# Altium schematic sheet 11_Audio_CODEC.SchDoc
size A3; SheetNumber: 2; SheetTotal: 21
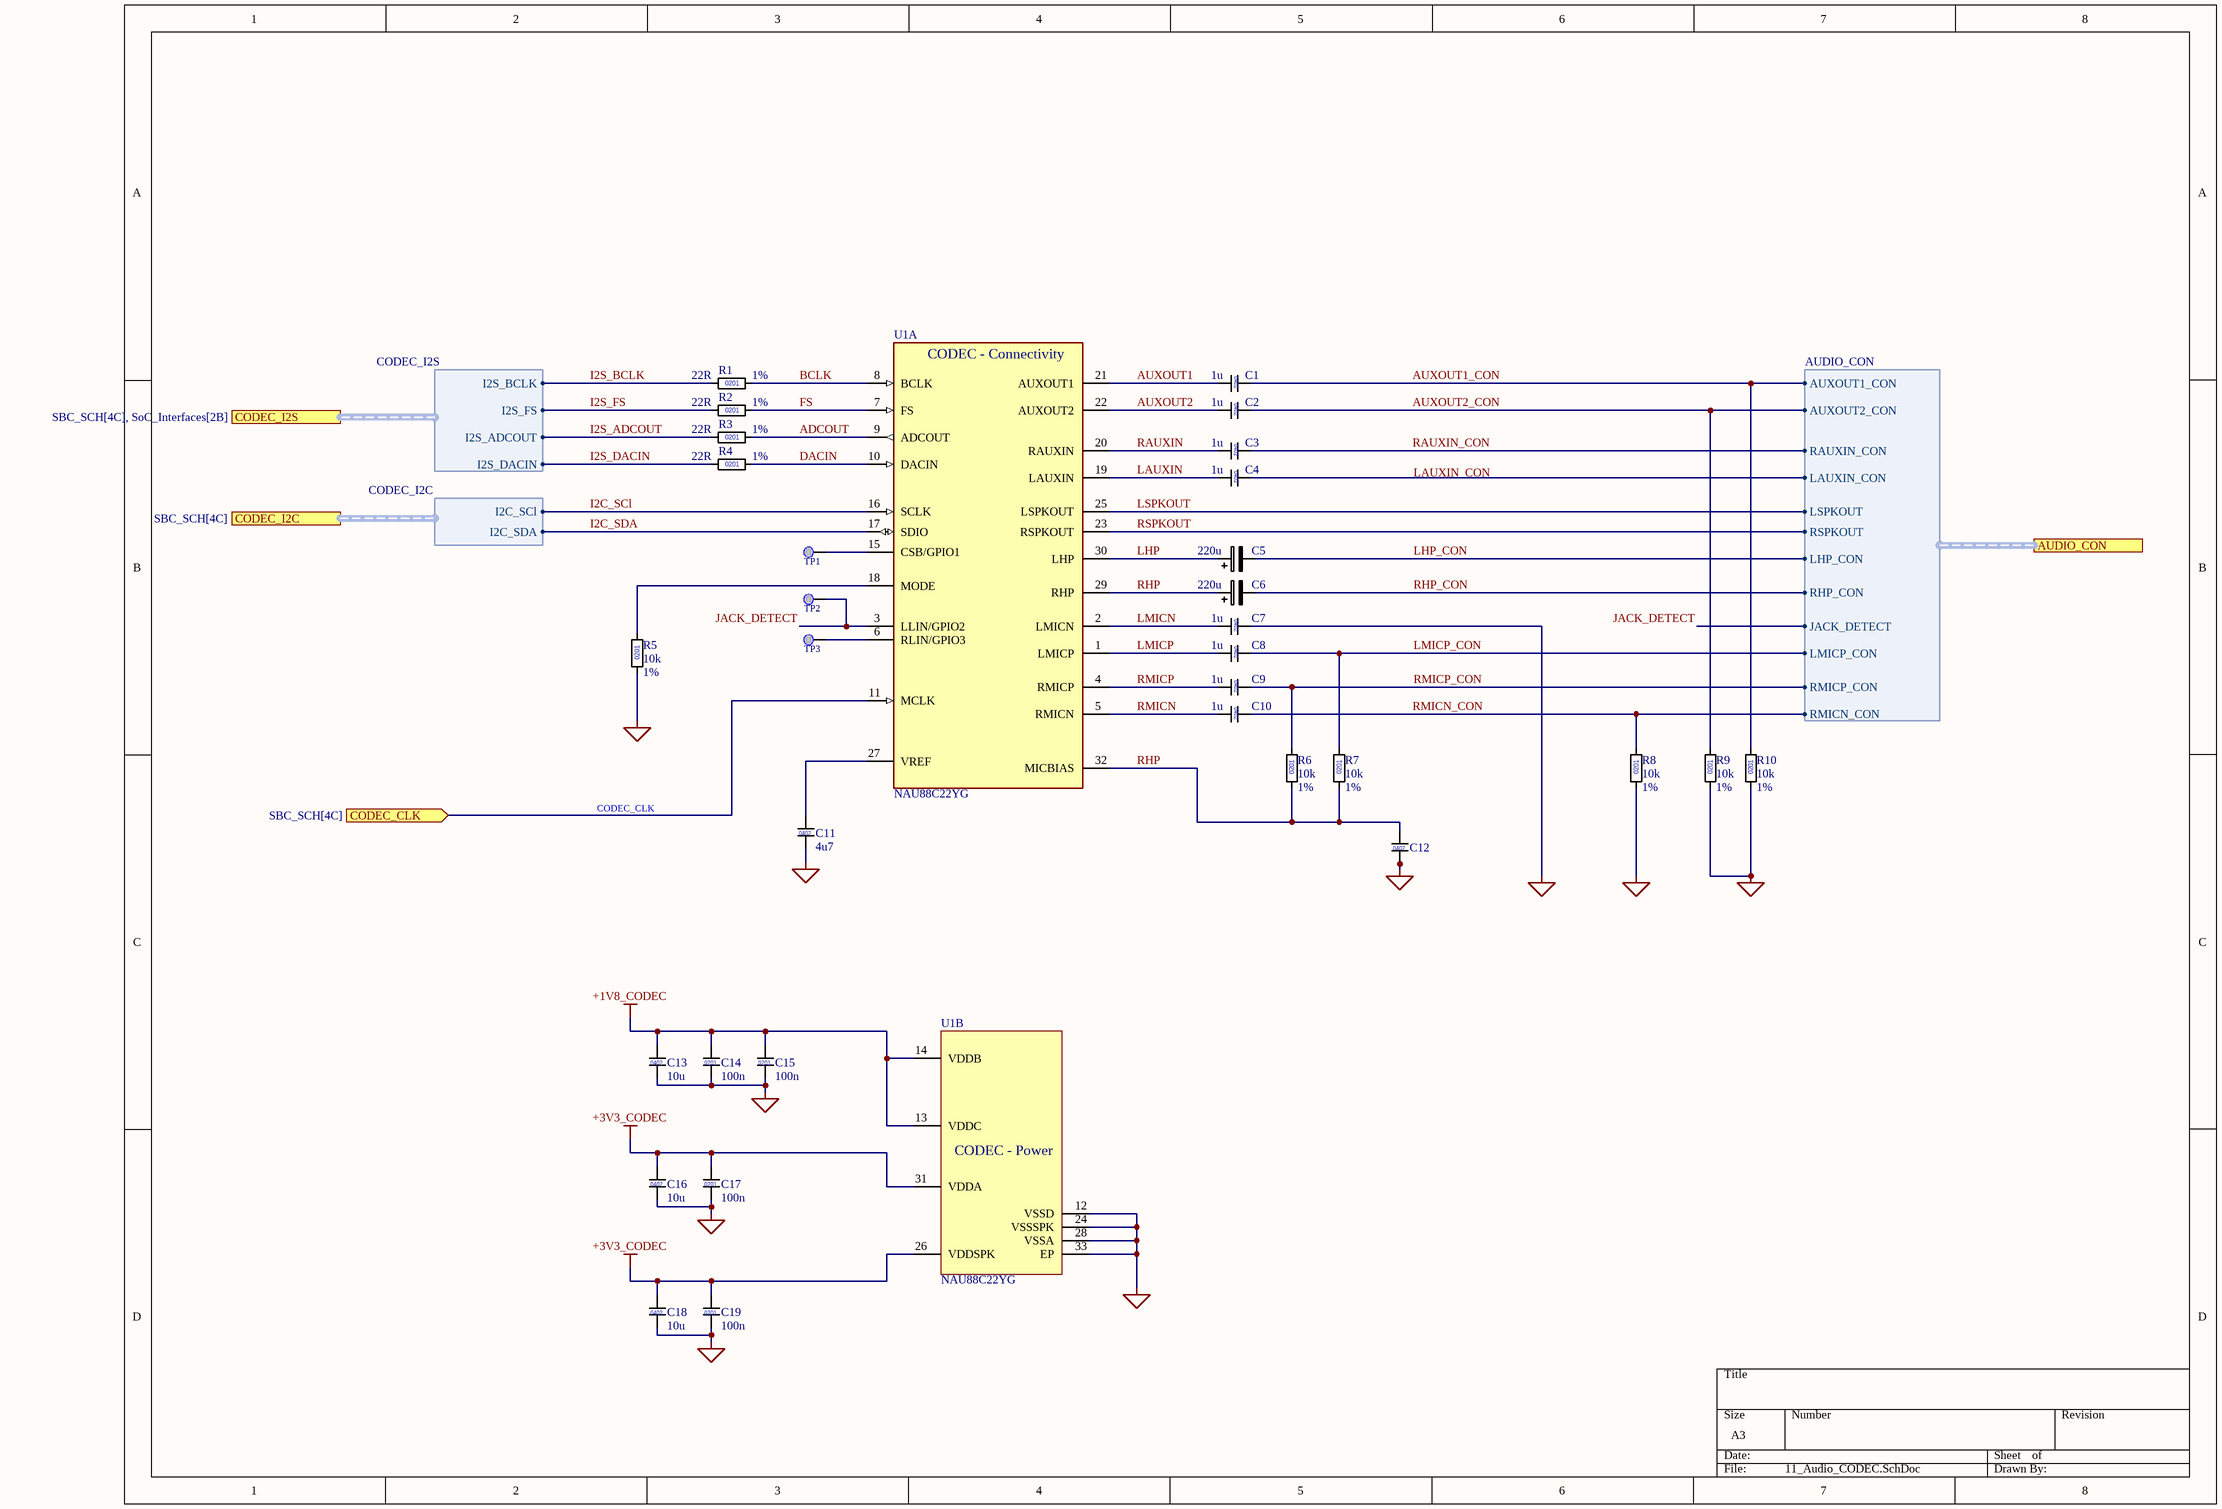
[diagram p0: 11_Audio_CODEC.SchDoc]

## Parts
C1  1u  [C0402]
C2  1u  [C0402]
C3  1u  [C0402]
C4  1u  [C0402]
C5  220u
C6  220u
C7  1u  [C0402]
C8  1u  [C0402]
C9  1u  [C0402]
C10  1u  [C0402]
C11  4u7  [C0402]
C12  1u  [C0402]  (value not drawn)
C13  value 10u  [C0402]  (hidden comment: 4u7)
C14  value 100n  [C0201]  (hidden comment: C_0201)
C15  value 100n  [C0201]  (hidden comment: C_0201)
C16  value 10u  [C0402]  (hidden comment: 4u7)
C17  value 100n  [C0201]  (hidden comment: C_0201)
C18  value 10u  [C0402]  (hidden comment: 4u7)
C19  value 100n  [C0201]  (hidden comment: C_0201)
R1  value 22R  Tolerance: 1%  [R0201]  (hidden comment: 0201)
R2  value 22R  Tolerance: 1%  [R0201]  (hidden comment: 0201)
R3  value 22R  Tolerance: 1%  [R0201]  (hidden comment: 0201)
R4  value 22R  Tolerance: 1%  [R0201]  (hidden comment: 0201)
R5  value 10k  Tolerance: 1%  [R0201]  (hidden comment: 0201)
R6  value 10k  Tolerance: 1%  [R0201]  (hidden comment: 0201)
R7  value 10k  Tolerance: 1%  [R0201]  (hidden comment: 0201)
R8  value 10k  Tolerance: 1%  [R0201]  (hidden comment: 0201)
R9  value 10k  Tolerance: 1%  [R0201]  (hidden comment: 0201)
R10  value 10k  Tolerance: 1%  [R0201]  (hidden comment: 0201)
TP1  Testpoint 0.5mm  [TP_0.50mm]  (value not drawn)  (no BOM)
TP2  Testpoint 0.5mm  [TP_0.50mm]  (value not drawn)  (no BOM)
TP3  Testpoint 0.5mm  [TP_0.50mm]  (value not drawn)  (no BOM)
U1  NAU88C22YG  [VQFN-32-1EP_5x5mm_P0.5mm_EP3.5x3.5mm]  (parts A,B of 2)

## Ports
AUDIO_CON (harness AUDIO_CON, see SBC_SCH[4C], Audio_Connector[1B]), CODEC_CLK (in, see SBC_SCH[4C]), CODEC_I2C (harness CODEC_I2C, see SBC_SCH[4C]), CODEC_I2S (harness CODEC_I2S, see SBC_SCH[4C], SoC_Interfaces[2B])

## Harnesses
CODEC_I2S: I2S_BCLK, I2S_FS, I2S_ADCOUT, I2S_DACIN
CODEC_I2C: I2C_SCl, I2C_SDA
AUDIO_CON: AUXOUT1_CON, AUXOUT2_CON, RAUXIN_CON, LAUXIN_CON, LHP_CON, RHP_CON, LMICP_CON, RMICP_CON, RMICN_CON, LSPKOUT, RSPKOUT, JACK_DETECT

## Nets
+1V8_CODEC: C13.1 C14.1 C15.1 U1.13(VDDC) U1.14(VDDB)
+3V3_CODEC: C16.1 C17.1 C18.1 C19.1 U1.26(VDDSPK) U1.31(VDDA)
GND: C7.2 C11.2 C12.2 C13.2 C14.2 C15.2 C16.2 C17.2 C18.2 C19.2 R5.1 R8.1 R9.1 R10.1 U1.12(VSSD) U1.24(VSSSPK) U1.28(VSSA) U1.33(EP)
ADCOUT: R3.2 U1.9(ADCOUT)
AUXOUT1: C1.1 U1.21(AUXOUT1)
AUXOUT1_CON: C1.2 R10.2 ; port AUDIO_CON.AUXOUT1_CON
AUXOUT2: C2.1 U1.22(AUXOUT2)
AUXOUT2_CON: C2.2 R9.2 ; port AUDIO_CON.AUXOUT2_CON
BCLK: R1.2 U1.8(BCLK)
CODEC_CLK: U1.11(MCLK) ; port CODEC_CLK
DACIN: R4.2 U1.10(DACIN)
FS: R2.2 U1.7(FS)
I2C_SCl: U1.16(SCLK) ; port CODEC_I2C.I2C_SCl
I2C_SDA: U1.17(SDIO) ; port CODEC_I2C.I2C_SDA
I2S_ADCOUT: R3.1 ; port CODEC_I2S.I2S_ADCOUT
I2S_BCLK: R1.1 ; port CODEC_I2S.I2S_BCLK
I2S_DACIN: R4.1 ; port CODEC_I2S.I2S_DACIN
I2S_FS: R2.1 ; port CODEC_I2S.I2S_FS
JACK_DETECT: TP2.TP U1.3(LLIN/GPIO2) ; port AUDIO_CON.JACK_DETECT
LAUXIN: C4.1 U1.19(LAUXIN)
LHP: C5.1 U1.30(LHP)
LHP_CON: C5.2 ; port AUDIO_CON.LHP_CON
LMICN: C7.1 U1.2(LMICN)
LMICP: C8.1 U1.1(LMICP)
LMICP_CON: C8.2 R7.2 ; port AUDIO_CON.LMICP_CON
LSPKOUT: U1.25(LSPKOUT) ; port AUDIO_CON.LSPKOUT
RAUXIN: C3.1 U1.20(RAUXIN)
RAUXIN_CON: C3.2 ; port AUDIO_CON.RAUXIN_CON
RHP: C6.1 C12.1 R6.1 R7.1 U1.29(RHP) U1.32(MICBIAS)
RHP_CON: C6.2 ; port AUDIO_CON.RHP_CON
RMICN: C10.1 U1.5(RMICN)
RMICN_CON: C10.2 R8.2 ; port AUDIO_CON.RMICN_CON
RMICP: C9.1 U1.4(RMICP)
RMICP_CON: C9.2 R6.2 ; port AUDIO_CON.RMICP_CON
RSPKOUT: U1.23(RSPKOUT) ; port AUDIO_CON.RSPKOUT
NetC4_2: C4.2 ; port AUDIO_CON.LAUXIN_CON
NetC11_1: C11.1 U1.27(VREF)
NetR5_2: R5.2 U1.18(MODE)
NetTP1_TP: TP1.TP U1.15(CSB/GPIO1)
NetTP3_TP: TP3.TP U1.6(RLIN/GPIO3)

## Notes on the sheet
- Labels drawn without touching a wire or pin: LAUXIN_CON
- (in symbol C_0201) 0201
- (in symbol C_0402) 0402
- (in symbol NAU88C22YG, part A) CODEC - Connectivity
- (in symbol NAU88C22YG, part B) CODEC - Power

## Library data of the parts
C1-C4 C7-C13 C16 C18 = C_0402: MLCC 0402; Manufacturer_Name: *; Manufacturer_Part_Number: *
  C1-C4 C7-C10: Value: 1u
  C11: Value: 4u7
C5 C6 = C_Polarized: Polarized capacitor; Manufacturer_Name: *; Manufacturer_Part_Number: *; Value: 220u
C14 C15 C17 C19 = C_0201: MLCC 0201; Manufacturer_Name: *; Manufacturer_Part_Number: *
R1-R10 = R_0201: Manufacturer_Name: *; Manufacturer_Part_Number: *
U1 = NAU88C22YG: Audio CODEC 24 b I2S, PCM; Datasheet: https://datasheetspdf.com/pdf-file/1134755/nuvoton/NAU88C22/1; ComponentLink1Description: Datasheet; ComponentLink1URL: https://datasheetspdf.com/pdf-file/1134755/nuvoton/NAU88C22/1; Manufacturer_Name: *; Manufacturer_Part_Number: *